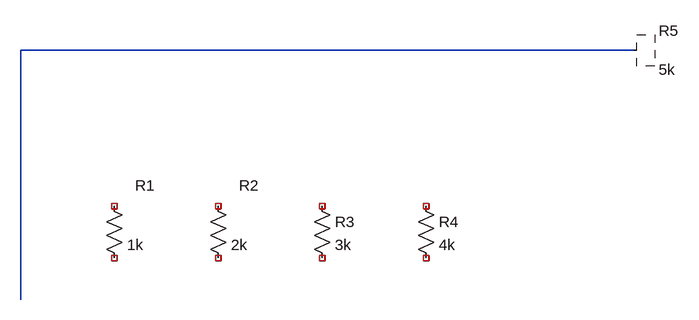
[diagram p0: schematic window_short.asc]
window_short.asc, the LTspice schematic file:
Version 4
SHEET 1 1040 400
WIRE -32 -64 912 -64
WIRE -32 -64 -32 320
SYMBOL res 96 160 R0
WINDOW 0 48 -16 Left 2
SYMATTR InstName R1
SYMATTR Value 1k
SYMBOL res 256 160 R0
WINDOW 0 48 -16 Left
SYMATTR InstName R2
SYMATTR Value 2k
SYMBOL res 416 160 R0
WINDOW 0 48 -16
SYMATTR InstName R3
SYMATTR Value 3k
SYMBOL res 576 160 R0
SYMATTR InstName R4
SYMATTR Value 4k
SYMBOL window_short 736 160 R0
SYMATTR InstName R5
SYMATTR Value 5k

The netlist it stands for:
* window_short.asc
R1 NC_01 NC_02 1k
R2 NC_03 NC_04 2k
R3 NC_05 NC_06 3k
R4 NC_07 NC_08 4k
* R5: 5k (symbol window_short not available, pin order unknown); nets seen at it: N001
.backanno
.end